# Altium schematic sheet TP4_Compact_FMC_Sht2.SchDoc
size B; SheetNumber: 2; SheetTotal: 2
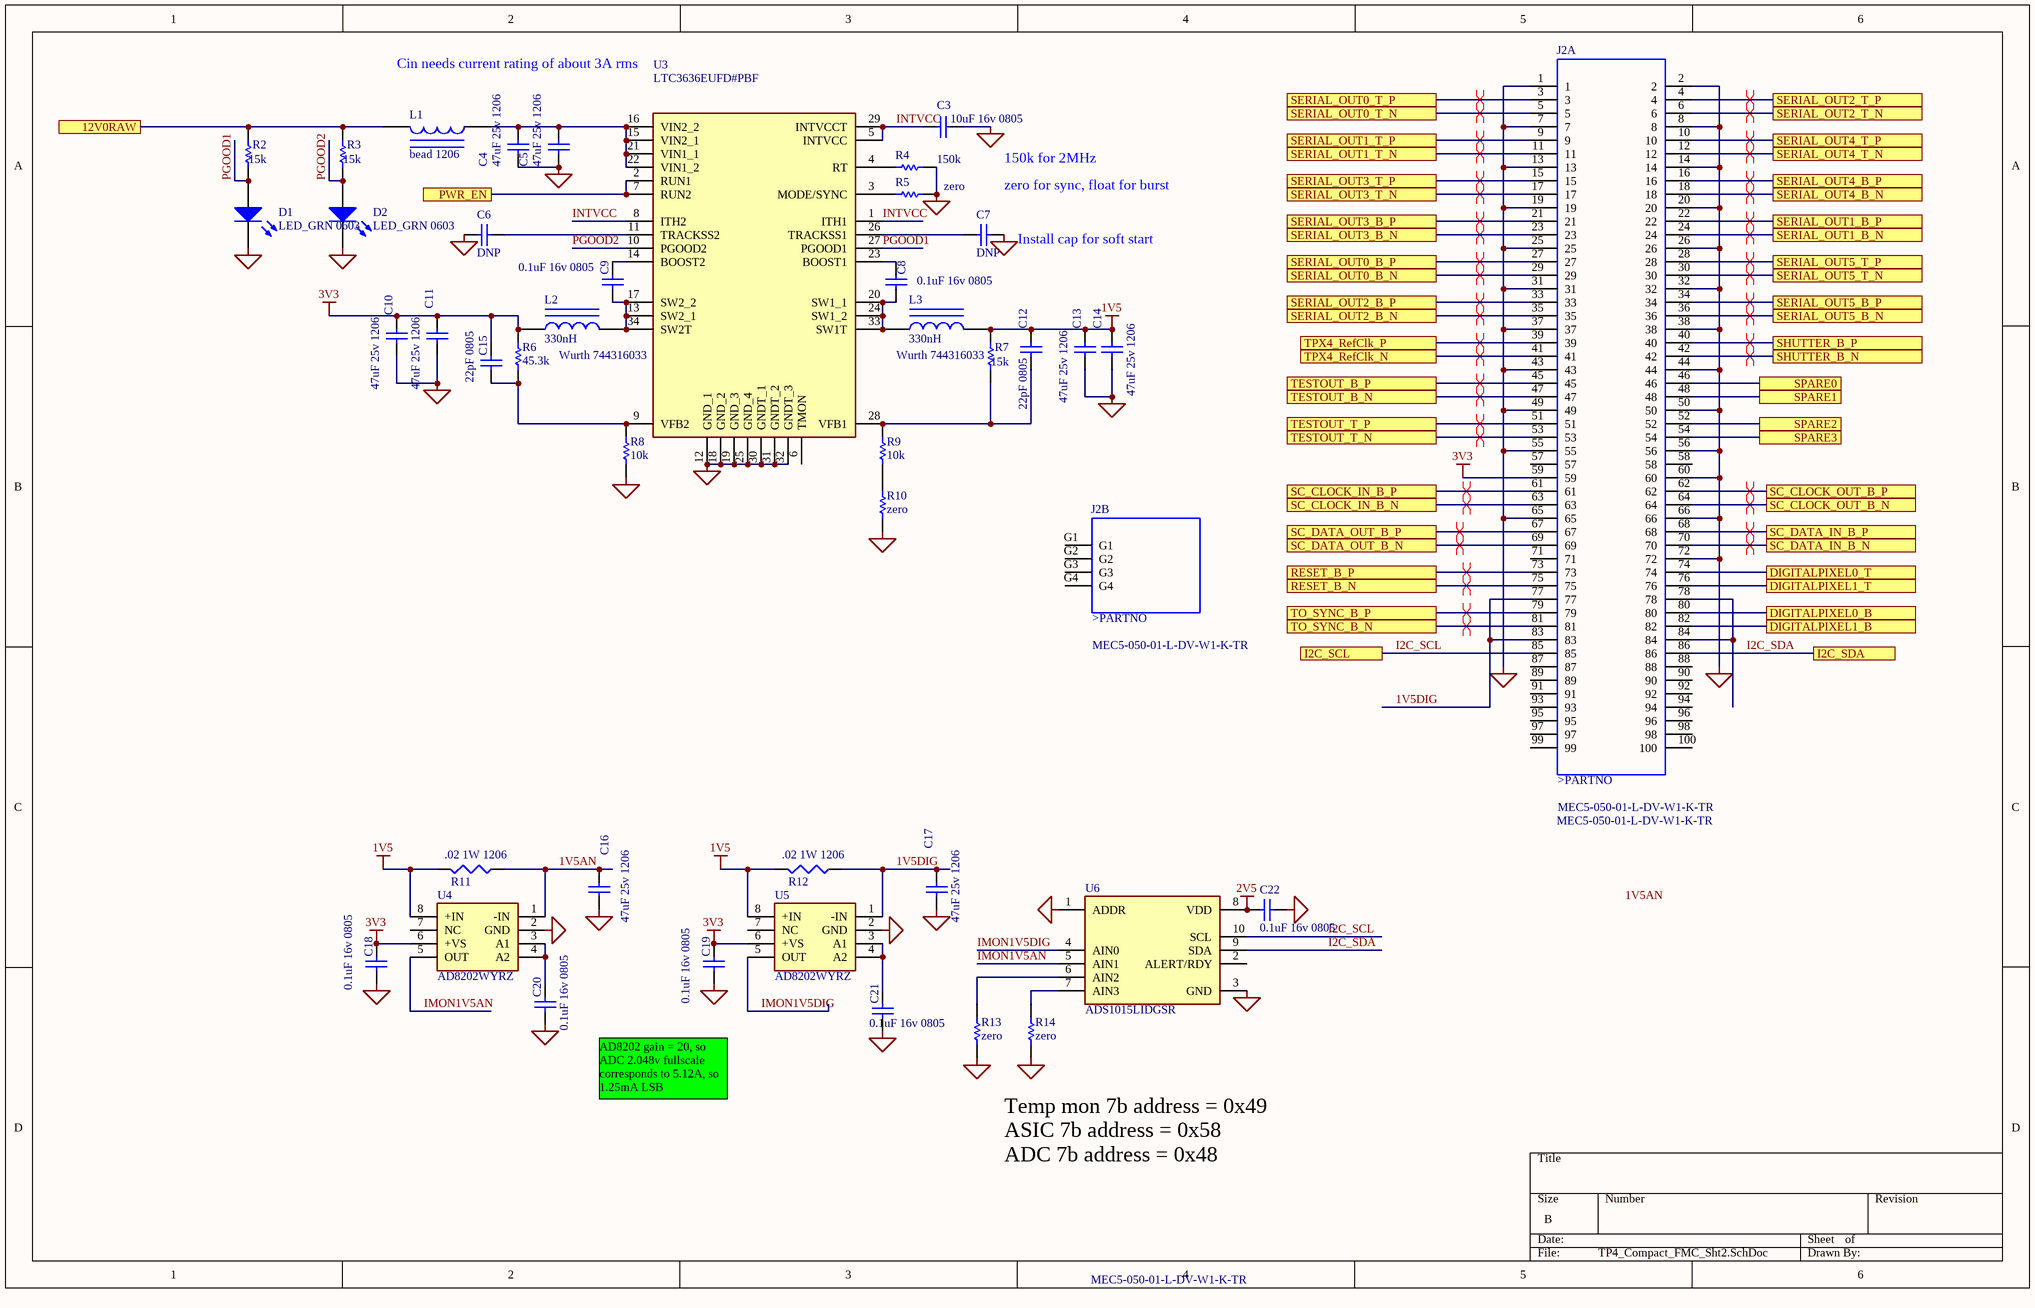
[diagram p0: TP4_Compact_FMC_Sht2.SchDoc]

## Parts
C3  value 10uF 16v 0805  [CAP0805]  (hidden comment: Cap)
C4  value 47uF 25v 1206  [1206]  (hidden comment: Cap)
C5  value 47uF 25v 1206  [1206]  (hidden comment: Cap)
C6  value DNP  [CAP0805]  (hidden comment: Cap)
C7  value DNP  [CAP0805]  (hidden comment: Cap)
C8  value 0.1uF 16v 0805  [CAP0805]  (hidden comment: Cap)
C9  value 0.1uF 16v 0805  [CAP0805]  (hidden comment: Cap)
C10  value 47uF 25v 1206  [1206]  (hidden comment: Cap)
C11  value 47uF 25v 1206  [1206]  (hidden comment: Cap)
C12  value 22pF 0805  [CAP0805]  (hidden comment: Cap)
C13  value 47uF 25v 1206  [1206]  (hidden comment: Cap)
C14  value 47uF 25v 1206  [1206]  (hidden comment: Cap)
C15  value 22pF 0805  [CAP0805]  (hidden comment: Cap)
C16  value 47uF 25v 1206  [1206]  (hidden comment: Cap)
C17  value 47uF 25v 1206  [1206]  (hidden comment: Cap)
C18  value 0.1uF 16v 0805  [CAP0805]  (hidden comment: Cap)
C19  value 0.1uF 16v 0805  [CAP0805]  (hidden comment: Cap)
C20  value 0.1uF 16v 0805  [CAP0805]  (hidden comment: Cap)
C21  value 0.1uF 16v 0805  [CAP0805]  (hidden comment: Cap)
C22  value 0.1uF 16v 0805  [CAP0805]  (hidden comment: Cap)
D1  LED_GRN 0603  [LED0603]
D2  LED_GRN 0603  [LED0603]
J2  MEC5-050-01-L-DV-W1-K-TR  [MEC5-050-01-L-DV-W1-K-TR]  (parts A,B of 2)
L1  value bead 1206  [1206]  (hidden comment: Inductor Iron)
L2  Wurth 744316033  value 330nH  [Inductor_5.6mm]
L3  Wurth 744316033  value 330nH  [Inductor_5.6mm]
R2  value 15k  [CAP0805]  (hidden comment: Res1)
R3  value 15k  [CAP0805]  (hidden comment: Res1)
R4  value 150k  [CAP0805]  (hidden comment: Res1)
R5  value zero  [CAP0805]  (hidden comment: Res1)
R6  value 45.3k  [CAP0805]  (hidden comment: Res1)
R7  value 15k  [CAP0805]  (hidden comment: Res1)
R8  value 10k  [CAP0805]  (hidden comment: Res1)
R9  value 10k  [CAP0805]  (hidden comment: Res1)
R10  value zero  [CAP0805]  (hidden comment: Res1)
R11  value .02 1W 1206  [CAP0805]  (hidden comment: Res)
R12  value .02 1W 1206  [CAP0805]  (hidden comment: Res)
R13  value zero  [CAP0805]  (hidden comment: Res1)
R14  value zero  [CAP0805]  (hidden comment: Res1)
U3  LTC3636EUFD#PBF  [LTC3636EUFDPBF]
U4  AD8202WYRZ  [SOIC127P600X175-8N]
U5  AD8202WYRZ  [SOIC127P600X175-8N]
U6  ADS1015LIDGSR  [SOP50P490X110-10N]

## Ports
12V0RAW (see TP4_Compact_FMC_Sht1[3D]), DIGITALPIXEL0_B (see TP4_Compact_FMC_Sht1[5B]), DIGITALPIXEL0_T (see TP4_Compact_FMC_Sht1[5B]), DIGITALPIXEL1_B (see TP4_Compact_FMC_Sht1[5B]), DIGITALPIXEL1_T (see TP4_Compact_FMC_Sht1[5B]), I2C_SCL (see TP4_Compact_FMC_Sht1[4B]), I2C_SDA (see TP4_Compact_FMC_Sht1[4B]), PWR_EN, RESET_B_N (see TP4_Compact_FMC_Sht1[5A]), RESET_B_P (see TP4_Compact_FMC_Sht1[5A]), SC_CLOCK_IN_B_N (see TP4_Compact_FMC_Sht1[4B]), SC_CLOCK_IN_B_P (see TP4_Compact_FMC_Sht1[4B]), SC_CLOCK_OUT_B_N (see TP4_Compact_FMC_Sht1[5A]), SC_CLOCK_OUT_B_P (see TP4_Compact_FMC_Sht1[5A]), SC_DATA_IN_B_N (see TP4_Compact_FMC_Sht1[5B]), SC_DATA_IN_B_P (see TP4_Compact_FMC_Sht1[5B]), SC_DATA_OUT_B_N (see TP4_Compact_FMC_Sht1[5A]), SC_DATA_OUT_B_P (see TP4_Compact_FMC_Sht1[5A]), SERIAL_OUT0_B_N (see TP4_Compact_FMC_Sht1[3A]), SERIAL_OUT0_B_P (see TP4_Compact_FMC_Sht1[3A]), SERIAL_OUT0_T_N (see TP4_Compact_FMC_Sht1[4A]), SERIAL_OUT0_T_P (see TP4_Compact_FMC_Sht1[4A]), SERIAL_OUT1_B_N (see TP4_Compact_FMC_Sht1[3A]), SERIAL_OUT1_B_P (see TP4_Compact_FMC_Sht1[3A]), SERIAL_OUT1_T_N (see TP4_Compact_FMC_Sht1[2A]), SERIAL_OUT1_T_P (see TP4_Compact_FMC_Sht1[2A]), SERIAL_OUT2_B_N (see TP4_Compact_FMC_Sht1[3A]), SERIAL_OUT2_B_P (see TP4_Compact_FMC_Sht1[3A]), SERIAL_OUT2_T_N (see TP4_Compact_FMC_Sht1[2A]), SERIAL_OUT2_T_P (see TP4_Compact_FMC_Sht1[2A]), SERIAL_OUT3_B_N (see TP4_Compact_FMC_Sht1[3A]), SERIAL_OUT3_B_P (see TP4_Compact_FMC_Sht1[3A]), SERIAL_OUT3_T_N (see TP4_Compact_FMC_Sht1[2A]), SERIAL_OUT3_T_P (see TP4_Compact_FMC_Sht1[2A]), SERIAL_OUT4_B_N (see TP4_Compact_FMC_Sht1[1A]), SERIAL_OUT4_B_P (see TP4_Compact_FMC_Sht1[1A]), SERIAL_OUT4_T_N (see TP4_Compact_FMC_Sht1[2A]), SERIAL_OUT4_T_P (see TP4_Compact_FMC_Sht1[2A]), SERIAL_OUT5_B_N (see TP4_Compact_FMC_Sht1[1A]), SERIAL_OUT5_B_P (see TP4_Compact_FMC_Sht1[1A]), SERIAL_OUT5_T_N (see TP4_Compact_FMC_Sht1[2A]), SERIAL_OUT5_T_P (see TP4_Compact_FMC_Sht1[2A]), SHUTTER_B_N (see TP4_Compact_FMC_Sht1[4B]), SHUTTER_B_P (see TP4_Compact_FMC_Sht1[4B]), SPARE0 (see TP4_Compact_FMC_Sht1[1C]), SPARE1 (see TP4_Compact_FMC_Sht1[1C]), SPARE2 (see TP4_Compact_FMC_Sht1[1C]), SPARE3 (see TP4_Compact_FMC_Sht1[1C]), TESTOUT_B_N (see TP4_Compact_FMC_Sht1[4A]), TESTOUT_B_P (see TP4_Compact_FMC_Sht1[4A]), TESTOUT_T_N (see TP4_Compact_FMC_Sht1[4A]), TESTOUT_T_P (see TP4_Compact_FMC_Sht1[4A]), TO_SYNC_B_N (see TP4_Compact_FMC_Sht1[5A]), TO_SYNC_B_P (see TP4_Compact_FMC_Sht1[5A]), TPX4_RefClk_N (see TP4_Compact_FMC_Sht1[4A]), TPX4_RefClk_P (see TP4_Compact_FMC_Sht1[4A])

## Nets
1V5: C12.2 C13.2 C14.2 L3.2 R7.2 R11.2 R12.2 U4.8(+IN) U5.8(+IN)
2V5: C22.2 U6.8(VDD)
3V3: C10.2 C11.2 C15.2 C18.2 C19.2 J2.59 L2.1 R6.2 U4.6(+VS) U5.6(+VS)
GND: C3.1 C4.1 C5.1 C6.2 C7.1 C10.1 C11.1 C13.1 C14.1 C16.1 C17.1 C18.1 C19.1 C20.1 C21.1 C22.1 D1.2(K) D2.2(K) J2.1 J2.2 J2.7 J2.8 J2.13 J2.14 J2.19 J2.20 J2.25 J2.26 J2.31 J2.32 J2.37 J2.38 J2.43 J2.44 J2.49 J2.50 J2.55 J2.56 J2.60 J2.65 J2.66 J2.72 R4.1 R5.1 R8.1 R10.1 R13.1 R14.1 U3.12(GND_1) U3.18(GND_2) U3.19(GND_3) U3.25(GND_4) U3.30(GNDT_1) U3.31(GNDT_2) U3.32(GNDT_3) U4.2(GND) U5.2(GND) U6.1(ADDR) U6.3(GND)
1V5AN: C16.2 R11.1 U4.1(-IN)
1V5DIG: C17.2 J2.77 J2.83 R12.1 U5.1(-IN)
12V0RAW: L1.2 R2.2 R3.2 ; port 12V0RAW
DIGITALPIXEL0_B: J2.80 ; port DIGITALPIXEL0_B
DIGITALPIXEL0_T: J2.74 ; port DIGITALPIXEL0_T
DIGITALPIXEL1_B: J2.82 ; port DIGITALPIXEL1_B
DIGITALPIXEL1_T: J2.76 ; port DIGITALPIXEL1_T
I2C_SCL: J2.85 U6.10(SCL) ; port I2C_SCL
I2C_SDA: J2.86 U6.9(SDA) ; port I2C_SDA
IMON1V5AN: U4.5(OUT) U6.5(AIN1)
IMON1V5DIG: U5.5(OUT) U6.4(AIN0)
INTVCC: C3.2 U3.1(ITH1) U3.5(INTVCC) U3.8(ITH2) U3.29(INTVCCT)
PGOOD1: D1.1(A) R2.1 U3.27(PGOOD1)
PGOOD2: D2.1(A) R3.1 U3.10(PGOOD2)
PWR_EN: U3.2(RUN1) U3.7(RUN2) ; port PWR_EN
RESET_B_N: J2.75 ; port RESET_B_N
RESET_B_P: J2.73 ; port RESET_B_P
SC_CLOCK_IN_B_N: J2.63 ; port SC_CLOCK_IN_B_N
SC_CLOCK_IN_B_P: J2.61 ; port SC_CLOCK_IN_B_P
SC_CLOCK_OUT_B_N: J2.64 ; port SC_CLOCK_OUT_B_N
SC_CLOCK_OUT_B_P: J2.62 ; port SC_CLOCK_OUT_B_P
SC_DATA_IN_B_N: J2.70 ; port SC_DATA_IN_B_N
SC_DATA_IN_B_P: J2.68 ; port SC_DATA_IN_B_P
SC_DATA_OUT_B_N: J2.69 ; port SC_DATA_OUT_B_N
SC_DATA_OUT_B_P: J2.67 ; port SC_DATA_OUT_B_P
SERIAL_OUT0_B_N: J2.29 ; port SERIAL_OUT0_B_N
SERIAL_OUT0_B_P: J2.27 ; port SERIAL_OUT0_B_P
SERIAL_OUT0_T_N: J2.5 ; port SERIAL_OUT0_T_N
SERIAL_OUT0_T_P: J2.3 ; port SERIAL_OUT0_T_P
SERIAL_OUT1_B_N: J2.24 ; port SERIAL_OUT1_B_N
SERIAL_OUT1_B_P: J2.22 ; port SERIAL_OUT1_B_P
SERIAL_OUT1_T_N: J2.11 ; port SERIAL_OUT1_T_N
SERIAL_OUT1_T_P: J2.9 ; port SERIAL_OUT1_T_P
SERIAL_OUT2_B_N: J2.35 ; port SERIAL_OUT2_B_N
SERIAL_OUT2_B_P: J2.33 ; port SERIAL_OUT2_B_P
SERIAL_OUT2_T_N: J2.6 ; port SERIAL_OUT2_T_N
SERIAL_OUT2_T_P: J2.4 ; port SERIAL_OUT2_T_P
SERIAL_OUT3_B_N: J2.23 ; port SERIAL_OUT3_B_N
SERIAL_OUT3_B_P: J2.21 ; port SERIAL_OUT3_B_P
SERIAL_OUT3_T_N: J2.17 ; port SERIAL_OUT3_T_N
SERIAL_OUT3_T_P: J2.15 ; port SERIAL_OUT3_T_P
SERIAL_OUT4_B_N: J2.18 ; port SERIAL_OUT4_B_N
SERIAL_OUT4_B_P: J2.16 ; port SERIAL_OUT4_B_P
SERIAL_OUT4_T_N: J2.12 ; port SERIAL_OUT4_T_N
SERIAL_OUT4_T_P: J2.10 ; port SERIAL_OUT4_T_P
SERIAL_OUT5_B_N: J2.36 ; port SERIAL_OUT5_B_N
SERIAL_OUT5_B_P: J2.34 ; port SERIAL_OUT5_B_P
SERIAL_OUT5_T_N: J2.30 ; port SERIAL_OUT5_T_N
SERIAL_OUT5_T_P: J2.28 ; port SERIAL_OUT5_T_P
SHUTTER_B_N: J2.42 ; port SHUTTER_B_N
SHUTTER_B_P: J2.40 ; port SHUTTER_B_P
SPARE0: J2.46 ; port SPARE0
SPARE1: J2.48 ; port SPARE1
SPARE2: J2.52 ; port SPARE2
SPARE3: J2.54 ; port SPARE3
TESTOUT_B_N: J2.47 ; port TESTOUT_B_N
TESTOUT_B_P: J2.45 ; port TESTOUT_B_P
TESTOUT_T_N: J2.53 ; port TESTOUT_T_N
TESTOUT_T_P: J2.51 ; port TESTOUT_T_P
TO_SYNC_B_N: J2.81 ; port TO_SYNC_B_N
TO_SYNC_B_P: J2.79 ; port TO_SYNC_B_P
TPX4_RefClk_N: J2.41 ; port TPX4_RefClk_N
TPX4_RefClk_P: J2.39 ; port TPX4_RefClk_P
NetC4_2: C4.2 C5.2 L1.1 U3.15(VIN2_1) U3.16(VIN2_2) U3.21(VIN1_1) U3.22(VIN1_2)
NetC6_1: C6.1 U3.11(TRACKSS2)
NetC7_2: C7.2 U3.26(TRACKSS1)
NetC8_1: C8.1 L3.1 U3.20(SW1_1) U3.24(SW1_2) U3.33(SW1T)
NetC8_2: C8.2 U3.23(BOOST1)
NetC9_1: C9.1 L2.2 U3.13(SW2_1) U3.17(SW2_2) U3.34(SW2T)
NetC9_2: C9.2 U3.14(BOOST2)
NetC12_1: C12.1 R7.1 R9.2 U3.28(VFB1)
NetC15_1: C15.1 R6.1 R8.2 U3.9(VFB2)
NetC20_2: C20.2 U4.3(A1) U4.4(A2)
NetC21_2: C21.2 U5.3(A1) U5.4(A2)
NetJ2_78: J2.78 J2.84
NetR4_2: R4.2 U3.4(RT)
NetR5_2: R5.2 U3.3(MODE/SYNC)
NetR9_1: R9.1 R10.2
NetR13_2: R13.2 U6.6(AIN2)
NetR14_2: R14.2 U6.7(AIN3)

Not connected (* = marked no-connect by the designer): J2 57 58 71 87 88 89 90 91 92 93 94 95 96 97 98 99 100 G1 G2 G3 G4; U3 6(TMON); U4 7(NC); U5 7(NC); U6 2(ALERT/RDY)

## Layout directives
differential pair: RESET_B_N, RESET_B_P, SC_CLOCK_IN_B_N, SC_CLOCK_IN_B_P, SC_CLOCK_OUT_B_N, SC_CLOCK_OUT_B_P, SC_DATA_IN_B_N, SC_DATA_IN_B_P, SC_DATA_OUT_B_N, SC_DATA_OUT_B_P, SERIAL_OUT0_B_N, SERIAL_OUT0_B_P, SERIAL_OUT0_T_N, SERIAL_OUT0_T_P, SERIAL_OUT1_B_N, SERIAL_OUT1_B_P, SERIAL_OUT1_T_N, SERIAL_OUT1_T_P, SERIAL_OUT2_B_N, SERIAL_OUT2_B_P, SERIAL_OUT2_T_N, SERIAL_OUT2_T_P, SERIAL_OUT3_B_N, SERIAL_OUT3_B_P, SERIAL_OUT3_T_N, SERIAL_OUT3_T_P, SERIAL_OUT4_B_N, SERIAL_OUT4_B_P, SERIAL_OUT4_T_N, SERIAL_OUT4_T_P, SERIAL_OUT5_B_N, SERIAL_OUT5_B_P, SERIAL_OUT5_T_N, SERIAL_OUT5_T_P, SHUTTER_B_N, SHUTTER_B_P, TESTOUT_B_N, TESTOUT_B_P, TESTOUT_T_N, TESTOUT_T_P, TO_SYNC_B_N, TO_SYNC_B_P, TPX4_RefClk_N, TPX4_RefClk_P

## Notes on the sheet
- Cin needs current rating of about 3A rms
- 150k for 2MHz
- (near C7) zero for sync, float for burst
- (near C7) Install cap for soft start
- AD8202 gain = 20, so ADC 2.048v fullscale corresponds to 5.12A, so 1.25mA LSB
- Temp mon 7b address = 0x49
  ASIC 7b address = 0x58
  ADC 7b address = 0x48
- Labels drawn without touching a wire or pin: 1V5AN
- (in symbol MEC5-050-01-L-DV-W1-K-TR, part A) >PARTNO
- (in symbol MEC5-050-01-L-DV-W1-K-TR, part B) >PARTNO

## Library data of the parts
C3 = Cap: Capacitor; OrderNo: 1276-2872-1-ND; Published: 8-Jun-2000; LatestRevisionDate: 17-Jul-2002; LatestRevisionNote: Re-released for DXP Platform.; PackageReference: RAD-0.3; Publisher: Altium Limited; PackageDescription: Radial Cap, Thru-Hole; 2 Leads; 0.3 in Pin Spacing
C4 C5 C10 C11 C13 C14 C16 C17 = Cap: Capacitor; OrderNo: 445-8047-1-ND; Published: 8-Jun-2000; LatestRevisionDate: 17-Jul-2002; LatestRevisionNote: Re-released for DXP Platform.; PackageReference: RAD-0.3; Publisher: Altium Limited; PackageDescription: Radial Cap, Thru-Hole; 2 Leads; 0.3 in Pin Spacing
C6 C7 = Cap: Capacitor; Published: 8-Jun-2000; LatestRevisionDate: 17-Jul-2002; LatestRevisionNote: Re-released for DXP Platform.; PackageReference: RAD-0.3; Publisher: Altium Limited; PackageDescription: Radial Cap, Thru-Hole; 2 Leads; 0.3 in Pin Spacing
C8 C9 C18-C22 = Cap: Capacitor; OrderNo: 399-C0805C104K4RACTUCT-ND; CostEach: 0; Published: 8-Jun-2000; LatestRevisionDate: 17-Jul-2002; LatestRevisionNote: Re-released for DXP Platform.; PackageReference: RAD-0.3; Publisher: Altium Limited; PackageDescription: Radial Cap, Thru-Hole; 2 Leads; 0.3 in Pin Spacing; Supplier: Digikey
C12 C15 = Cap: Capacitor; OrderNo: 399-C0805C220J5GACTUCT-ND; Published: 8-Jun-2000; LatestRevisionDate: 17-Jul-2002; LatestRevisionNote: Re-released for DXP Platform.; PackageReference: RAD-0.3; Publisher: Altium Limited; PackageDescription: Radial Cap, Thru-Hole; 2 Leads; 0.3 in Pin Spacing
D1 D2 = LED2: Red LED, SM; EM_PN: L62301CT-ND; OrderNo: L62305CT-ND; Supplier: Digikey
J2 = MEC5-050-01-L-DV-W1-K-TR: MF: Samtec; Package: None; MP: MEC5-050-01-L-DV-W1-K-TR; Value: *; Availability: Unavailable; Price: None
L1 = Inductor Iron: Magnetic-Core Inductor; Published: 24-Mar-1999; LatestRevisionDate: 17-Jul-2002; LatestRevisionNote: Re-released for DXP Platform.; PackageReference: AXIAL-0.9; Publisher: Altium Limited; PackageDescription: Axial Device, Thru-Hole; 2 Leads; 0.9 in Pin Spacing
L2 L3 = Inductor Iron: Magnetic-Core Inductor; OrderNo: DK 732-6173-1-ND; Published: 24-Mar-1999; LatestRevisionDate: 17-Jul-2002; LatestRevisionNote: Re-released for DXP Platform.; PackageReference: AXIAL-0.9; Publisher: Altium Limited; PackageDescription: Axial Device, Thru-Hole; 2 Leads; 0.9 in Pin Spacing
R2-R10 R13 R14 = Res1: Resistor; Published: 8-Jun-2000; LatestRevisionDate: 17-Jul-2002; LatestRevisionNote: Re-released for DXP Platform.; PackageReference: AXIAL-0.3; Publisher: Altium Limited; PackageDescription: Axial Device, Thru-Hole; 2 Leads; 0.3 in Pin Spacing
R11 R12 = Res: Resistor, SM; OrderNo: RHM.003ALCT-ND; CostEach: 0; Supplier: Digikey
U3 = LTC3636EUFD#PBF: Integrated Circuit; Manufacturer_Name: Analog Devices; Datasheet Link: https://www.arrow.com/en/products/ltc3636eufdpbf/analog-devices; Height: 0.8mm; Manufacturer_Part_Number: LTC3636EUFD#PBF; Mouser Part Number: 584-LTC3636EUFDPBF; Mouser Price/Stock: https://www.mouser.co.uk/ProductDetail/Analog-Devices/LTC3636EUFDPBF?qs=BZBei1rCqCAF%252BjKW6tHubg%3D%3D; Arrow Part Number: LTC3636EUFD#PBF; Arrow Price/Stock: https://www.arrow.com/en/products/ltc3636eufdpbf/analog-devices?region=nac
U4 U5 = AD8202WYRZ: Integrated Circuit; Manufacturer_Name: Analog Devices; OrderNo: AD8202YRZ-R7CT-ND; Datasheet Link: http://www.analog.com/static/imported-files/data_sheets/AD8202.pdf; Height: 1.75mm; Manufacturer_Part_Number: AD8202WYRZ; Mouser Part Number: 584-AD8202WYRZ; Mouser Price/Stock: https://www.mouser.com/Search/Refine.aspx?Keyword=584-AD8202WYRZ; Arrow Part Number: AD8202WYRZ; Arrow Price/Stock: https://www.arrow.com/en/products/ad8202wyrz/analog-devices?region=nac; Supplier: Digikey
U6 = ADS1015LIDGSR: Integrated Circuit; Manufacturer_Name: Texas Instruments; Datasheet Link: https://www.ti.com/lit/ds/symlink/ads1015l.pdf?ts=1755949738915&ref_url=https%253A%252F%252Fwww.google.com%252F; Height: 1.1mm; Manufacturer_Part_Number: ADS1015LIDGSR; Mouser Part Number: 595-ADS1015LIDGSR; Mouser Price/Stock: https://www.mouser.co.uk/ProductDetail/Texas-Instruments/ADS1015LIDGSR?qs=2wMNvWM5ZX4Z9D3W5OO6Eg%3D%3D; Arrow Part Number: ADS1015LIDGSR; Arrow Price/Stock: https://www.arrow.com/en/products/ads1015lidgsr/texas-instruments?utm_currency=USD&region=nac